# Altium schematic sheet NanoD1_Storage.SchDoc
size 420 x 297 mm; SheetNumber: 3; SheetTotal: 8
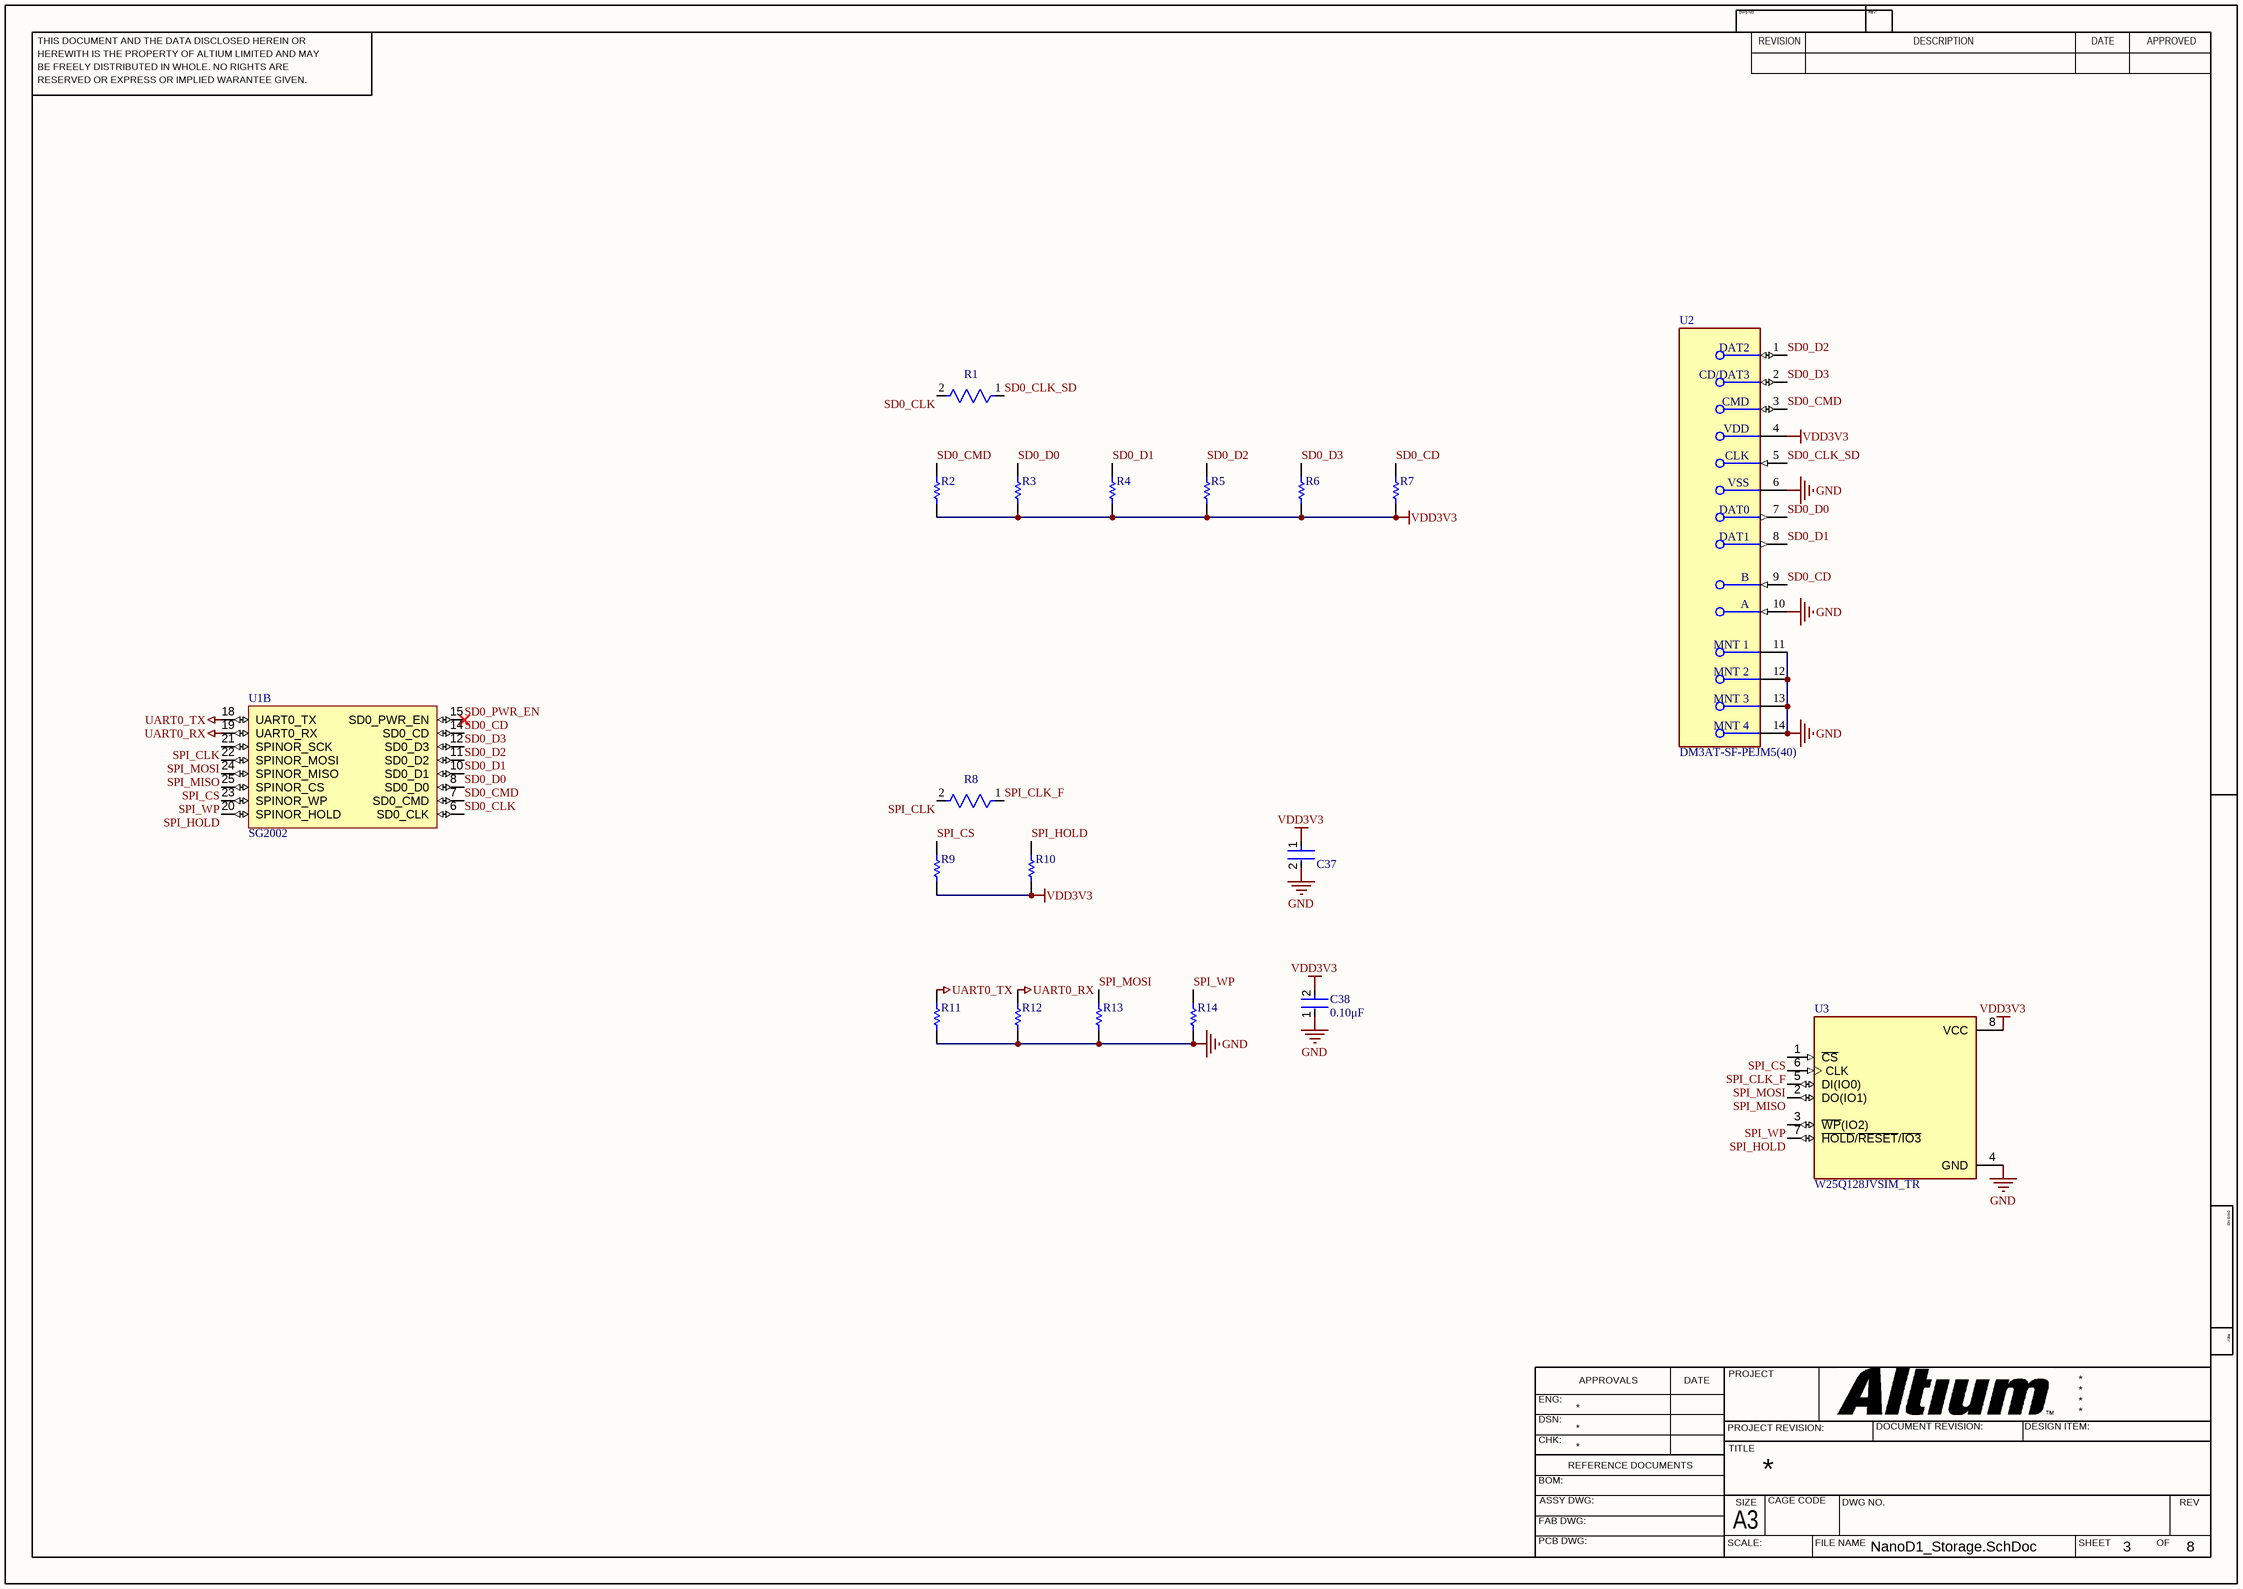
[diagram p0: NanoD1_Storage.SchDoc]

## Parts
C37  10uF  [FP-GRM188-0_15-IPC_B]  (value not drawn)
C38  value 0.10μF  [FP-GRM15-MFG]  (hidden comment: 100nF)
R1  22R  [FP-RC0402-0_4-IPC_A]  (value not drawn)
R2  10K  [RESC1005X40X25ML05T10]  (value not drawn)
R3  10K  [RESC1005X40X25ML05T10]  (value not drawn)
R4  10K  [RESC1005X40X25ML05T10]  (value not drawn)
R5  10K  [RESC1005X40X25ML05T10]  (value not drawn)
R6  10K  [RESC1005X40X25ML05T10]  (value not drawn)
R7  10K 1%  [RESC1005X40X25ML05T10]  (value not drawn)
R8  22R  [FP-RC0402-0_4-IPC_A]  (value not drawn)
R9  4.7K  [RESC1005X40X25ML05T10]  (value not drawn)
R10  4.7K  [RESC1005X40X25ML05T10]  (value not drawn)
R11  4.7K  [RESC1005X40X25ML05T10]  (value not drawn)
R12  4.7K  [RESC1005X40X25ML05T10]  (value not drawn)
R13  4.7K  [RESC1005X40X25ML05T10]  (value not drawn)
R14  4.7K  [RESC1005X40X25ML05T10]  (value not drawn)
U1  SG2002  [QFN88-9x9-0.35]  (part B of 7)
U2  DM3AT-SF-PEJM5(40)  [FP-DM3AT-SF-PEJM5_40-MFG]
U3  W25Q128JVSIM_TR  [SOIC127P790X216-8N]

## Nets
GND: C37.2 C38.1 R11.1 R12.1 R13.1 R14.1 U2.6(VSS) U2.10(A) U2.11(MNT_1) U2.12(MNT_2) U2.13(MNT_3) U2.14(MNT_4) U3.4(GND)
UART0_RX: R12.2 U1.19(UART0_RX)
UART0_TX: R11.2 U1.18(UART0_TX)
VDD3V3: C37.1 C38.2 R2.1 R3.1 R4.1 R5.1 R6.1 R7.1 R9.1 R10.1 U2.4(VDD) U3.8(VCC)
SD0_CD: R7.2 U1.14(SD0_CD) U2.9(B)
SD0_CLK: R1.2 U1.6(SD0_CLK)
SD0_CLK_SD: R1.1 U2.5(CLK)
SD0_CMD: R2.2 U1.7(SD0_CMD) U2.3(CMD)
SD0_D0: R3.2 U1.8(SD0_D0) U2.7(DAT0)
SD0_D1: R4.2 U1.10(SD0_D1) U2.8(DAT1)
SD0_D2: R5.2 U1.11(SD0_D2) U2.1(DAT2)
SD0_D3: R6.2 U1.12(SD0_D3) U2.2(CD/DAT3)
SD0_PWR_EN: U1.15(SD0_PWR_EN)
SPI_CLK: R8.2 U1.21(SPINOR_SCK)
SPI_CLK_F: R8.1 U3.6(CLK)
SPI_CS: R9.2 U1.25(SPINOR_CS) U3.1(~{CS})
SPI_HOLD: R10.2 U1.20(SPINOR_HOLD) U3.7(~{HOLD}/~{RESET}/~{IO3})
SPI_MISO: U1.24(SPINOR_MISO) U3.2(DO(IO1))
SPI_MOSI: R13.2 U1.22(SPINOR_MOSI) U3.5(DI(IO0))
SPI_WP: R14.2 U1.23(SPINOR_WP) U3.3(~{WP}(IO2))

## Notes on the sheet
- THIS DOCUMENT AND THE DATA DISCLOSED HEREIN OR
- HEREWITH IS THE PROPERTY OF ALTIUM LIMITED AND MAY
- DWG NO:
- REVISION
- REV:
- DESCRIPTION
- DATE
- APPROVED
- BE FREELY DISTRIBUTED IN WHOLE. NO RIGHTS ARE
- RESERVED OR EXPRESS OR IMPLIED WARANTEE GIVEN.
- ENG:
- APPROVALS
- PROJECT
- DSN:
- CHK:
- REFERENCE DOCUMENTS
- PROJECT REVISION:
- TITLE
- DOCUMENT REVISION:
- DESIGN ITEM:
- BOM:
- FAB DWG:
- PCB DWG:
- ASSY DWG:
- SCALE:
- A3
- SIZE
- CAGE CODE
- FILE NAME
- DWG NO.
- SHEET
- OF
- REV

## Library data of the parts
C37 = CMP-06035-003612-1: Chip Multilayer Ceramic Capacitors for General Purpose, 0603, 10uF, X5R, 15%, 20%, 10V; Tolerance: 20%; Dielectric: X5R; Package Quantity: 4000; Width: 0.8mm; Case/Package: 0603; Thickness: 0.035inch; Capacitance: 10uF; Voltage Rating: 10V; Voltage Rating (DC): 10V; Termination: SMD/SMT; Length: 1.6mm; Lead Free: Lead Free; Mount: Surface Mount; Height: 0.8mm; Depth: 0.8mm; Packaging: Tape and Reel; Weight: 0.000222oz; Min Operating Temperature: -55°C; Case Code (Metric): 1608; Max Operating Temperature: 85°C; Case Code (Imperial): 0603; Material: Ceramic
C38 = CMP-2100-03641-2: CAP CER 0.1UF 16V X7R 0402; Manufacturer Part Number: GRM155R71C104KA88D; Manufacturer: Murata; Standoff Height: 0mm; Tolerance: 10%; Voltage Rating: 16Vdc; Material: Ceramic; RoHS: TRUE; Temperature Characteristic: X7R; Octopart: https://octopart.com/grm155r71c104ka88d-murata-196880; Digikey Description: CAP CER 0.1UF 16V X7R 0402; Device Class L3: Ceramic Capacitors; Height: 0.55mm; ComponentLink2Description: Datasheet; Temperature Range Low: -55°C; Ipc Land Pattern Name: CAPC10050X219; ComponentLink2URL: https://search.murata.co.jp/Ceramy/image/img/A01X/G101/ENG/GRM155R71H471KA01-01A.pdf; Device Class L1: Passive Components; Lead Free: yes; Category: Cap; Package: GRM15; Temperature: -55°C to +125°C; Device Class L2: Capacitors; Capacitance: 0.10μF; Temperature Range High: +125°C; Mouser Description: 0402 0.1 uF 16V ±10 % Tolerance X7R SMT Multilayer Ceramic Capacitor
R1 R8 = CMP-2002-07520-2: Tolerance: 1%; Power Rating: 63mW; Voltage Rating: 50V; Temperature Coefficient: 100ppm/°C; Resistance: 22Ω; Termination: SMD/SMT; Depth: 500µm; Packaging: Tape & Reel; Height: 400µm; Width: 500µm; Case Code (Imperial): 0402; Length: 1mm; Schedule B: 8533210045, 8533210045|8533210045|8533210045|8533210045|8533210045|8533210045|8533210045|8533210045, 8533210045|8533210045|8533210045|8533210045|8533210045|8533210045|8533210045|8533210045|8533210045, 8533210045|8533210045|8533210045|8533210045|8533210045|8533210045|8533210045|8533210045|8533210045|8533210045; Case/Package: 0402; Max Operating Temperature: 155°C; Min Operating Temperature: -55°C; REACH SVHC: Unknown; RoHS: Compliant; Military Standard: Not; Voltage Rating (DC): 50V; Lead Free: Lead Free; Voltage Rating (AC): 50V; Number of Pins: 2; Composition: Thick Film
R2-R7 = CMP-2002-07353-1: Part Number: RC0402FR-0710KL; Manufacturer: Yageo / Phycomp
R9-R14 = CMP-1011-00586-2: Manufacturer: Yageo / Phycomp; Part Number: RC0402FR-074K7L
U1 = SG2002: RISC-V C906 / Cortex-A53 SoC, 256MB DDR3 SiP, QFN88 9x9 0.35mm
U2 = CMP-11597-000006-1: CONN MICRO SD R/A PUSH-PUSH SMD; Contact Resistance: 100mR; Insulation Resistance: 1GR; Gender: Receptacle; Max Voltage Rating (AC): 125V; Pitch: 1.1mm; Mating Cycles: 10000; Max Current Rating: 500mA; Connector Type: Connector; Number of Contacts: 8; Housing Material: Polymer; Flammability Rating: UL94 V-0; REACH SVHC: No SVHC; Lead Free: Lead Free; Package Quantity: 400; Length: 13.85mm; Number of Rows: 2; Series: DM3; Min Operating Temperature: -25°C; Voltage Rating (AC): 125V; Contact Material: Copper Alloy; Depth: 15.95mm; Contact Plating: Gold; Packaging: Tape and Reel; Width: 13.85mm; Orientation: Right Angle; Color: Black; Voltage Rating: 125V; Radiation Hardening: No; Termination: Solder; Current Rating: 500mA; Mount: Surface Mount; Max Operating Temperature: 85°C
U3 = W25Q128JVSIM_TR: FLASH - NOR Memory IC 128Mb (16M x 8) SPI - Quad I/O, QPI, DTR 133 MHz 8-SOIC; MF: Winbond Electronics; MP: W25Q128JVSIM TR; SnapEDA_Link: https://www.snapeda.com/parts/W25Q128JVSIM%20TR/Winbond/view-part/?ref=snap; Package: SOIC-8 Winbond Electronics; Value: *; Check_prices: https://www.snapeda.com/parts/W25Q128JVSIM%20TR/Winbond/view-part/?ref=eda